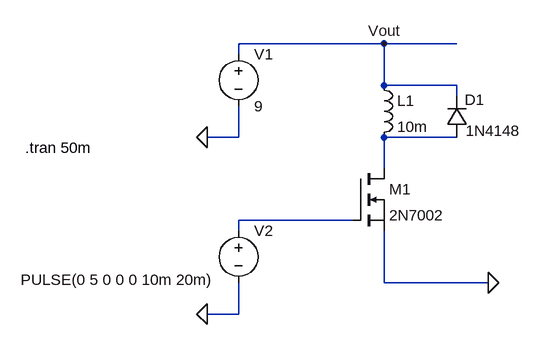
[diagram p0: schematic Project_1_MOSFET.asc]
Project_1_MOSFET.asc, the LTspice schematic file:
Version 4.1
SHEET 1 880 680
WIRE 272 64 48 64
WIRE 384 64 272 64
WIRE 48 80 48 64
WIRE 272 128 272 64
WIRE 384 128 272 128
WIRE 384 144 384 128
WIRE 48 208 48 160
WIRE 48 208 0 208
WIRE 384 208 272 208
WIRE 272 256 272 208
WIRE 224 336 48 336
WIRE 48 352 48 336
WIRE 272 432 272 352
WIRE 432 432 272 432
WIRE 48 480 48 432
WIRE 48 480 0 480
FLAG 432 432 0
FLAG 272 64 Vout
FLAG 0 208 0
FLAG 0 480 0
SYMBOL voltage 48 64 R0
WINDOW 123 0 0 Left 0
WINDOW 39 0 0 Left 0
SYMATTR InstName V1
SYMATTR Value 9
SYMBOL nmos 224 256 R0
SYMATTR InstName M1
SYMATTR Value 2N7002
SYMBOL voltage 48 336 R0
WINDOW 3 -335 91 Left 2
WINDOW 123 0 0 Left 0
WINDOW 39 0 0 Left 0
SYMATTR Value PULSE(0 5 0 0 0 10m 20m)
SYMATTR InstName V2
SYMBOL ind 256 112 R0
SYMATTR InstName L1
SYMATTR Value 10m
SYMATTR SpiceLine Rser=1m
SYMBOL diode 400 208 R180
WINDOW 0 -27 58 Left 2
WINDOW 3 -82 10 Left 2
SYMATTR InstName D1
SYMATTR Value 1N4148
TEXT -280 224 Left 2 !.tran 50m

The netlist it stands for:
* Project_1_MOSFET.asc
V1 Vout 0 9
M1 N001 N002 0 0 2N7002
V2 N002 0 PULSE(0 5 0 0 0 10m 20m)
L1 Vout N001 10m Rser=1m
D1 N001 Vout 1N4148
.model D D
.lib standard.dio
.model NMOS NMOS
.model PMOS PMOS
.lib standard.mos
.tran 50m
.backanno
.end